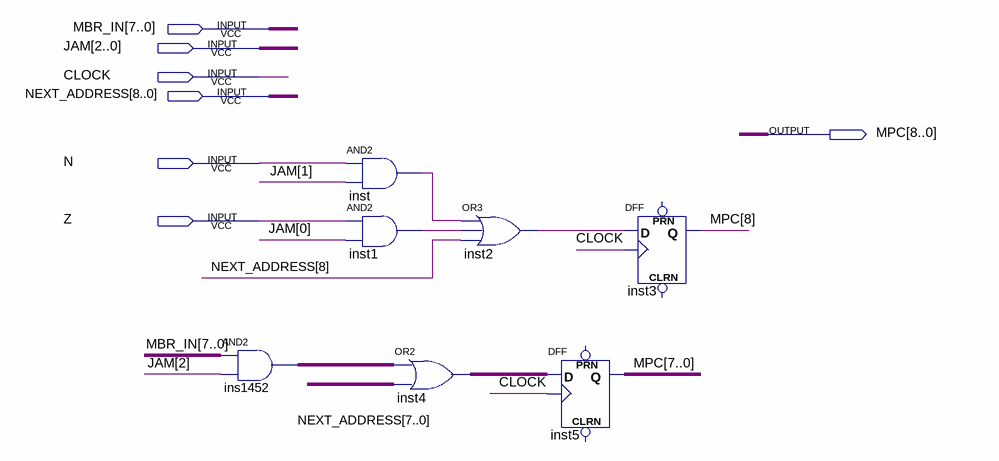
[diagram p0: schematic sheet]
// Quartus schematic MPC_GENERATOR.bdf as structural Verilog: 7 symbols, 7 pins
module MPC_GENERATOR (
  input  [7:0] MBR_IN,
  input  [2:0] JAM,
  input  CLOCK,
  input  [8:0] NEXT_ADDRESS,
  input  N,
  input  Z,
  output [8:0] MPC
);

  wire inst1_out, inst2_out, inst_out;
  wire [7:0] ins1452_out, inst4_out;

  assign ins1452_out = MBR_IN & {8{JAM[2]}};  // AND2 ins1452, 8 bits wide
  and inst (inst_out, N, JAM[1]);
  and inst1 (inst1_out, Z, JAM[0]);
  assign inst4_out = ins1452_out | NEXT_ADDRESS[7:0];  // OR2 inst4, 8 bits wide
  or inst2 (inst2_out, inst_out, inst1_out, NEXT_ADDRESS[8]);
  DFF inst5[7:0] (.CLK(CLOCK), .D(inst4_out), .Q(MPC[7:0]));  // open: CLRN, PRN
  DFF inst3 (.CLK(CLOCK), .D(inst2_out), .Q(MPC[8]));  // open: CLRN, PRN
endmodule
